# EasyEDA Pro project hardware_project.epro, schematic Schematic4, sheets 5 to 7 of 7

## Sheets
5 Lever-Shifter: Create Date: 2026-09-28; Page Name: P2; Update Date: 2026-09-28
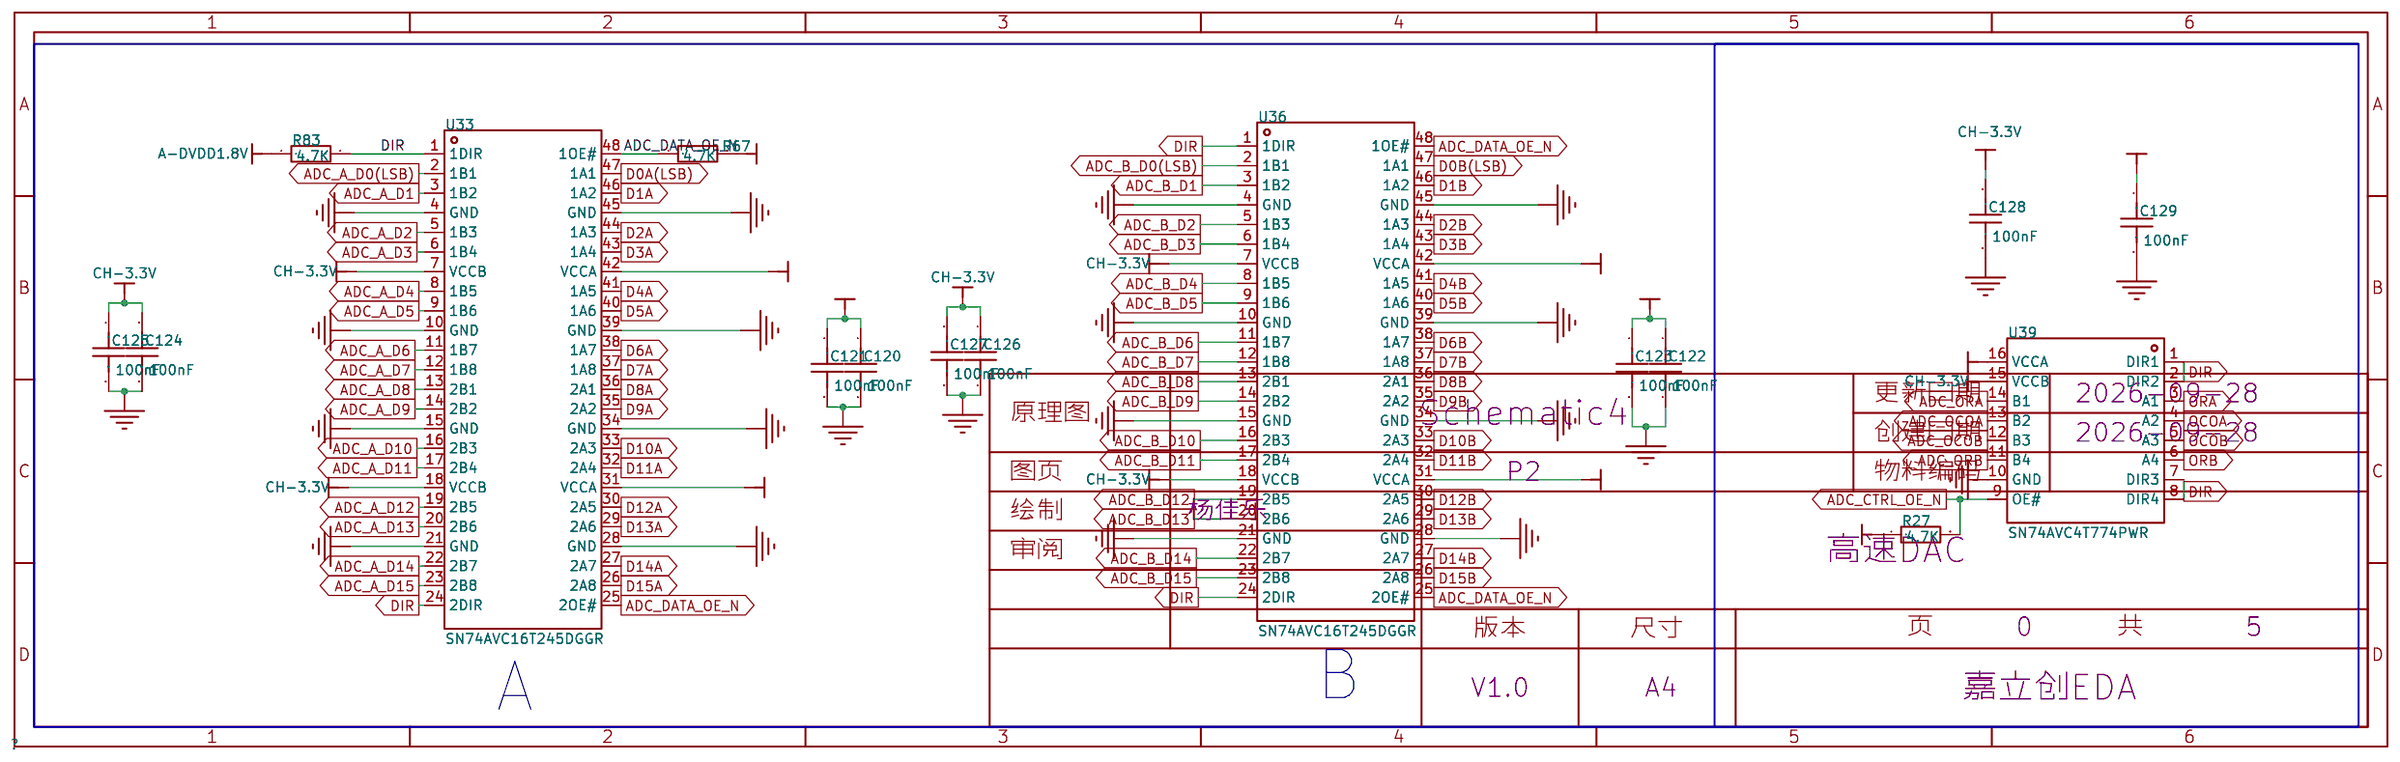
[diagram p4: Lever-Shifter]
6 AD9516-3: Create Date: 2026-09-28; Update Date: 2026-09-28
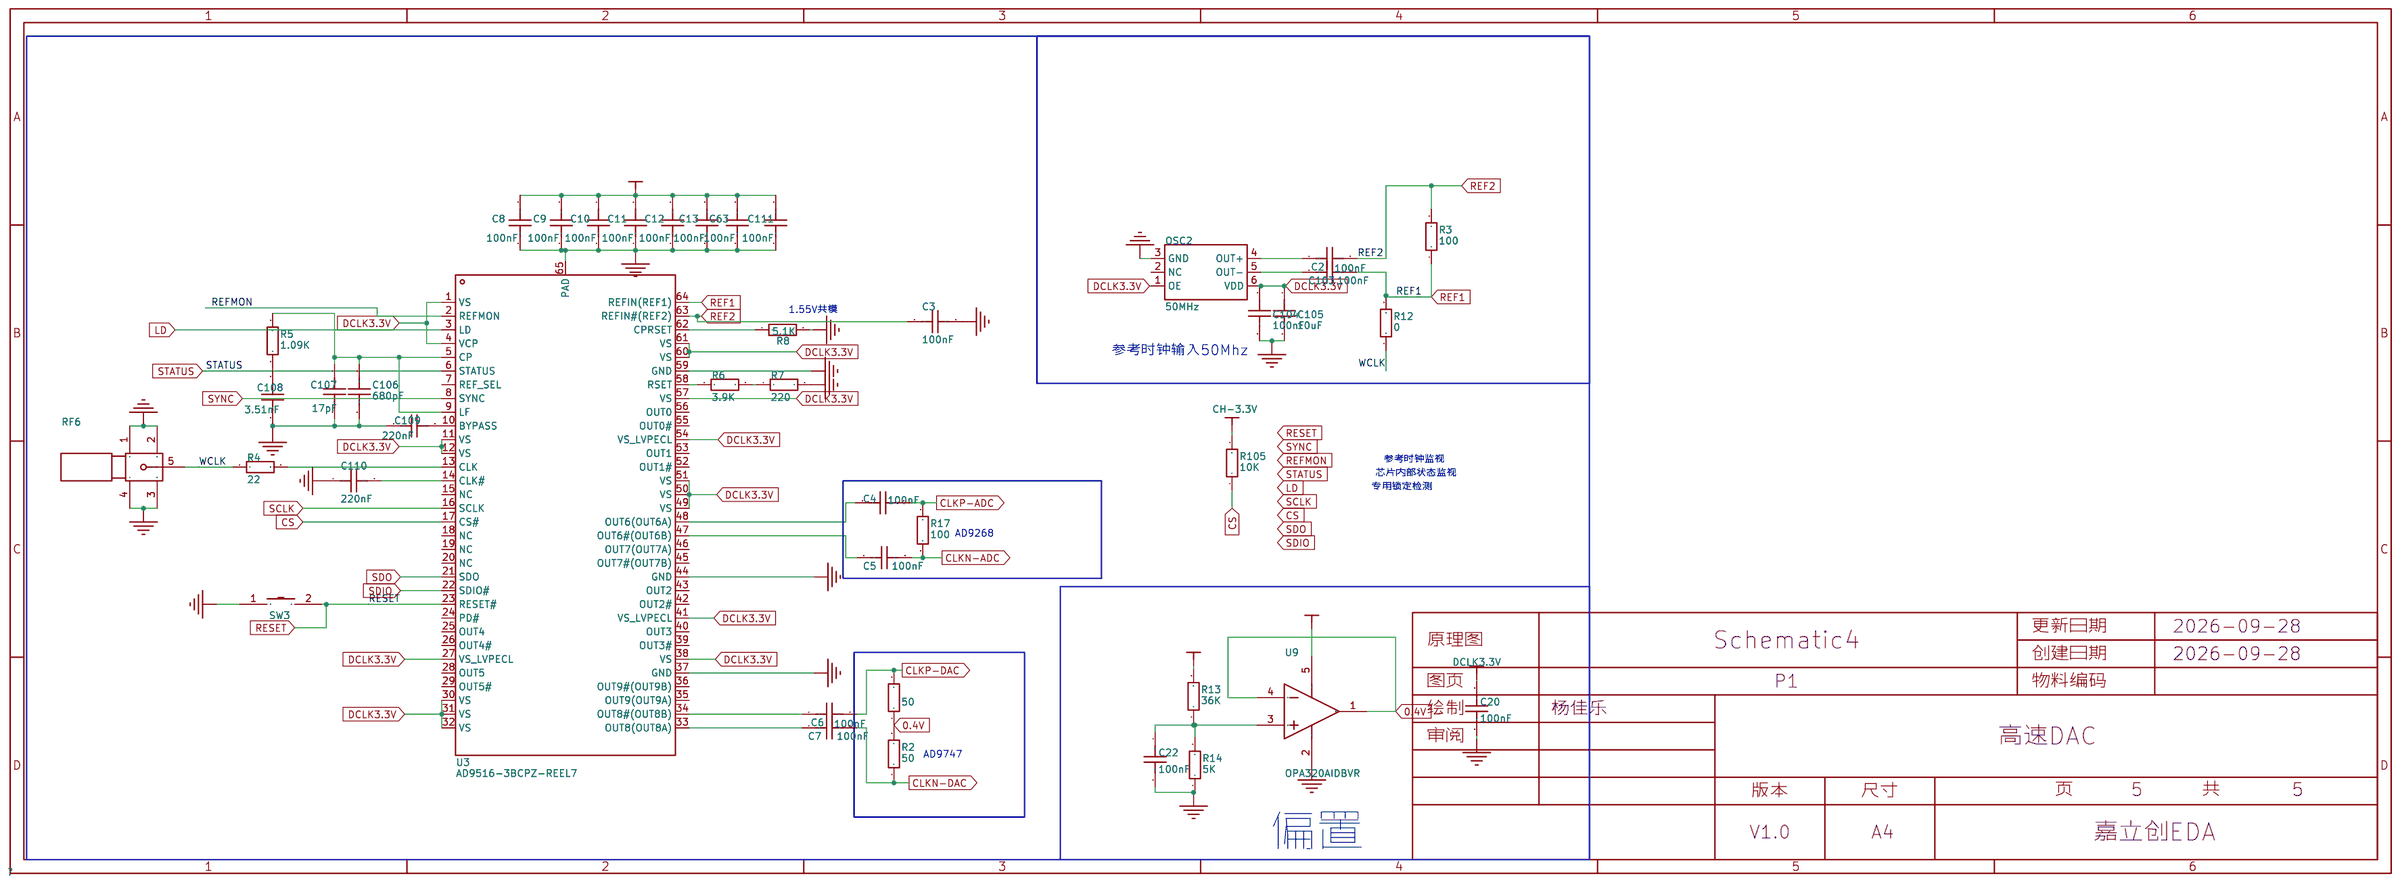
[diagram p5: AD9516-3]
7 AFE: Create Date: 2026-09-28; Update Date: 2026-09-28
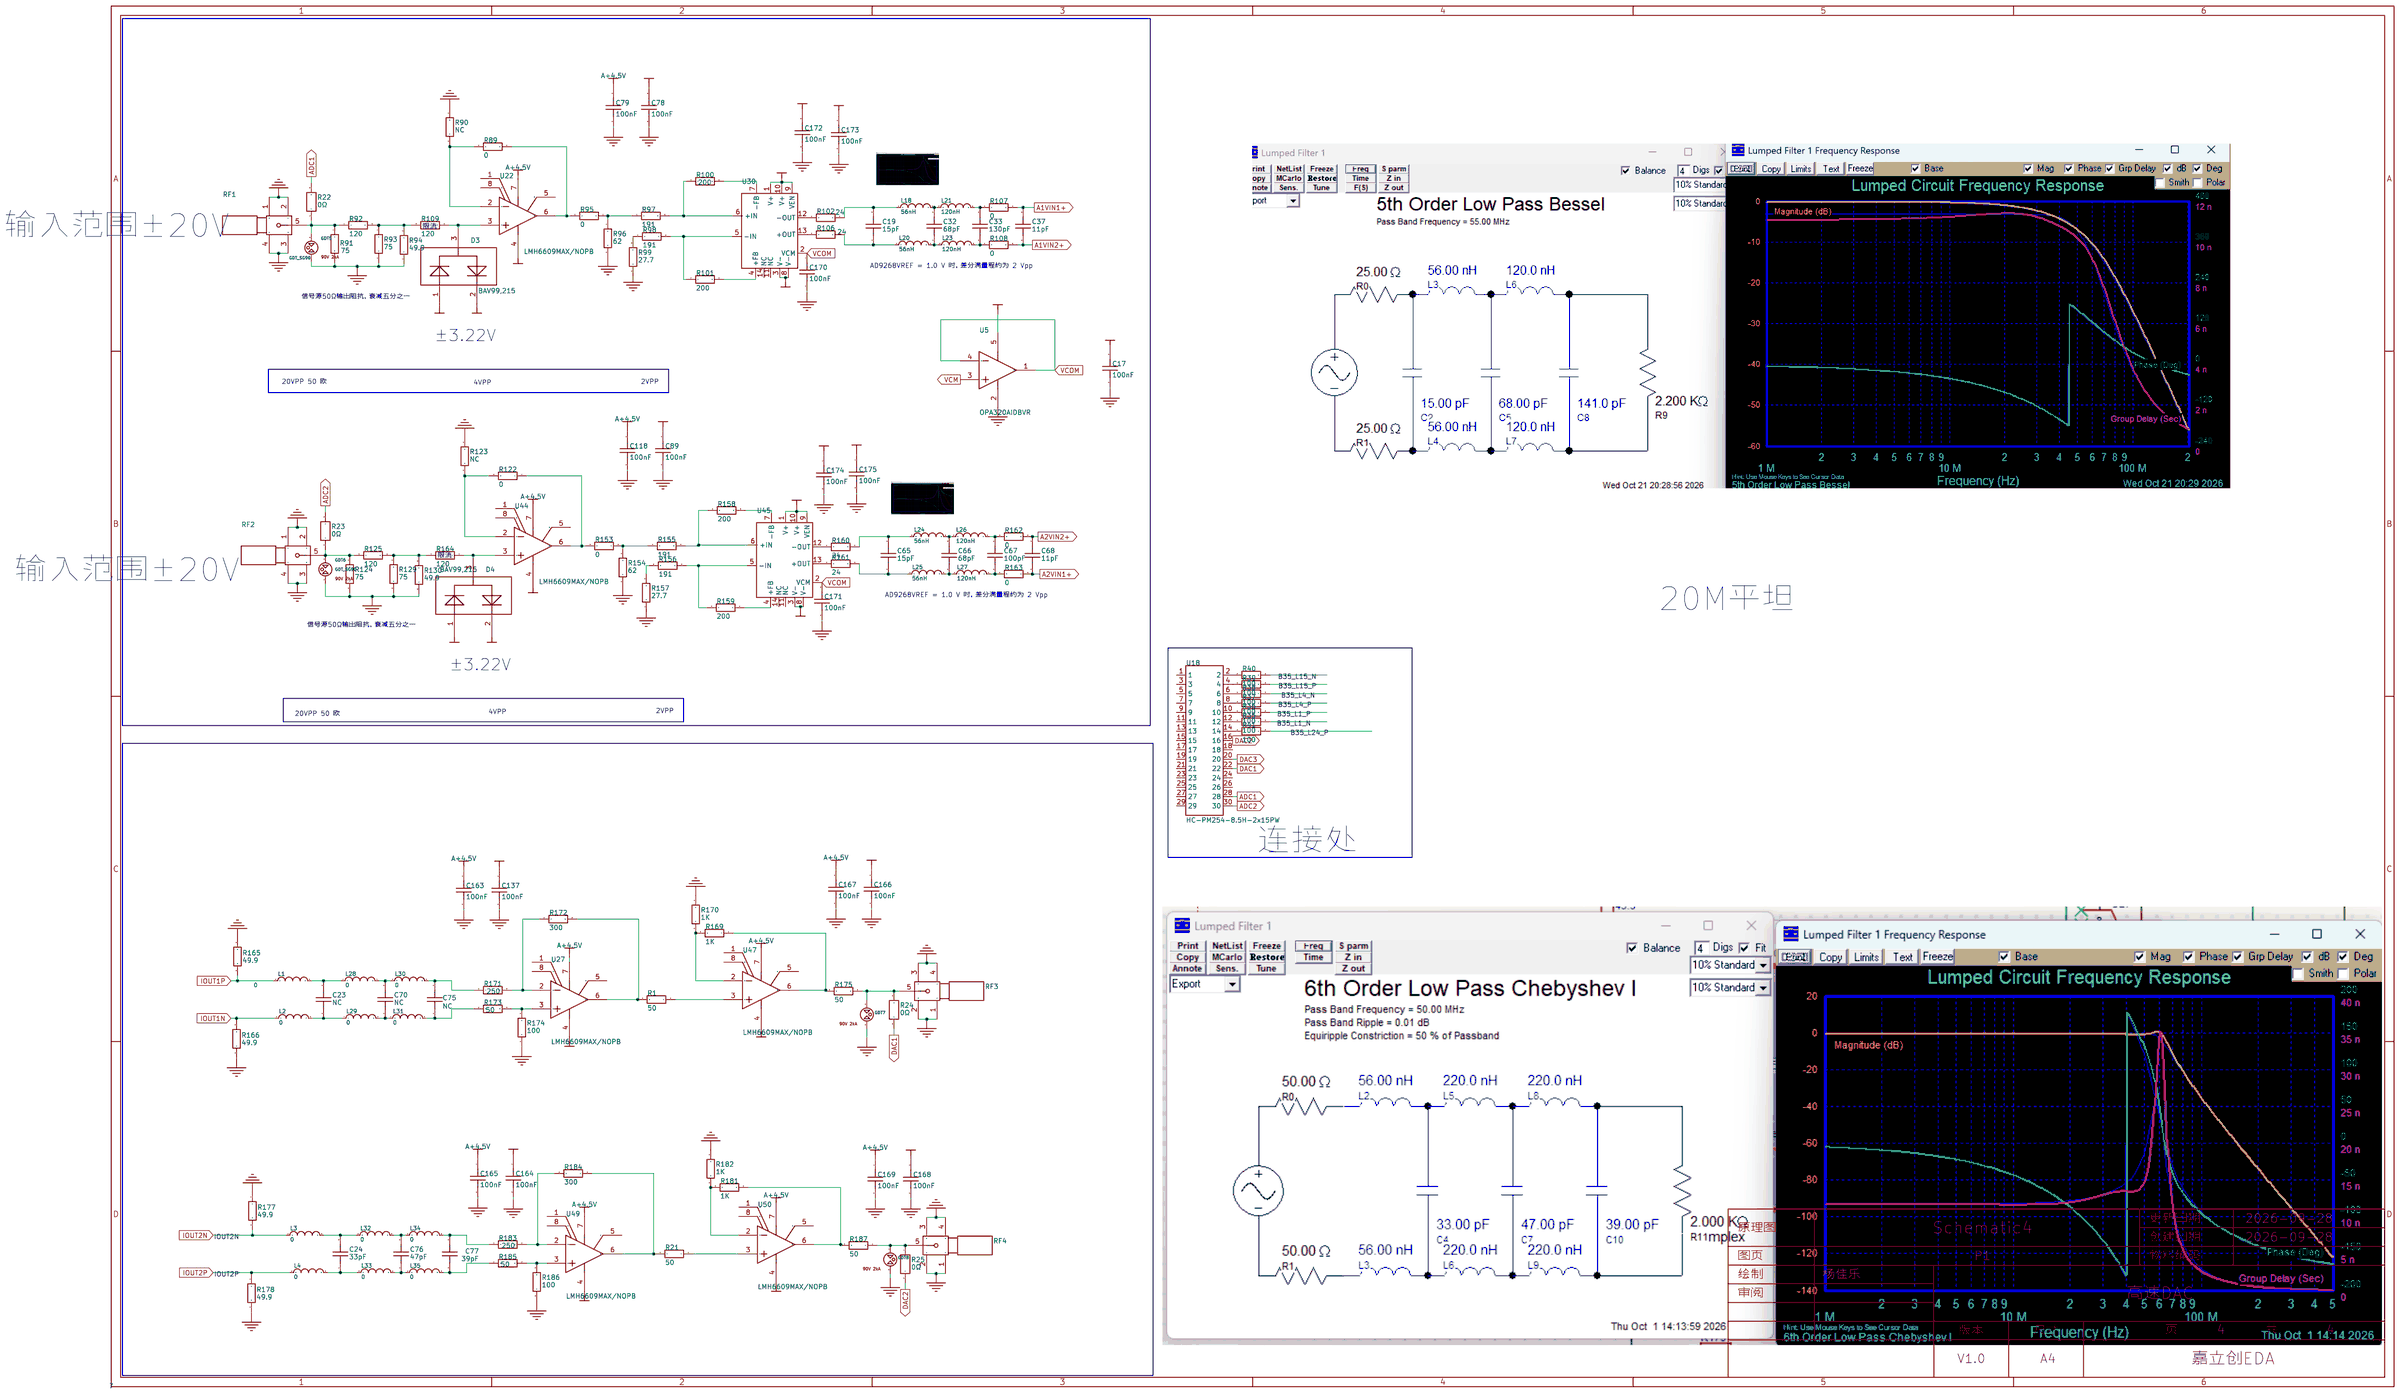
[diagram p6: AFE]

## Parts
sheet AD9516-3
C2  100nF  [C0603]
C3  100nF  [C0603]  (no BOM)
C4  100nF  [C0603]
C5  100nF  [C0603]
C6  100nF  [C0603]
C7  100nF  [C0603]
C8  100nF  [C0603]
C9  100nF  [C0603]
C10  100nF  [C0603]
C11  100nF  [C0603]
C12  100nF  [C0603]
C13  100nF  [C0603]
C20  100nF  [C0603]
C22  100nF  [C0603]
C63  100nF  [C0603]
C103  100nF  [C0603]
C104  100nF  [C0603]
C105  10uF  [C0603]
C106  680pF  [C0603]
C107  17pF  [C0603]
C108  3.51nF  [C0603]
C109  220nF  [C0603]
C110  220nF  [C0603]
C111  100nF  [C0603]
OSC2  50MHz  [OSC-SMD_6P-L3.2-W2.5-BL-1]
R2  50  [R0603]
R3  100  [R0603]
R4  22  [R0603]  (no BOM)
R5  1.09K  [R0603]
R6  3.9K  [R0603]
R7  220  [R0603]
R8  5.1K  [R0603]
R12  0  [R0603]  (no BOM)
R13  36K  [R0603]
R14  5K  [R0603]
R16  50  [R0603]
R17  100  [R0603]
R105  10K  [R0603]
RF6  -  [SMA-SMD_BWSMA-KE-P001]
SW3  -  [4脚平脚开关]
U3  AD9516-3BCPZ-REEL7  [LFCSP-64_L9.0-W9.0-P0.50-BL-EP6.2]
U9  OPA320AIDBVR  [SOT-23-5_L3.0-W1.7-P0.95-LS2.8-BR]
sheet AFE
C17  100nF  [C0603]
C19  15pF  [C0603]
C23  NC  [C0603]
C24  33pF  [C0603]
C32  68pF  [C0603]
C33  130pF  [C0603]
C37  11pF  [C0603]
C65  15pF  [C0603]
C66  68pF  [C0603]
C67  100pF  [C0603]
C68  11pF  [C0603]
C70  NC  [C0603]
C75  NC  [C0603]
C76  47pF  [C0603]
C77  39pF  [C0603]
C78  100nF  [C0603]
C79  100nF  [C0603]
C89  100nF  [C0603]
C118  100nF  [C0603]
C137  100nF  [C0603]
C163  100nF  [C0603]
C164  100nF  [C0603]
C165  100nF  [C0603]
C166  100nF  [C0603]
C167  100nF  [C0603]
C168  100nF  [C0603]
C169  100nF  [C0603]
C170  100nF  [C0603]
C171  100nF  [C0603]
C172  100nF  [C0603]
C173  100nF  [C0603]
C174  100nF  [C0603]
C175  100nF  [C0603]
D3  BAV99,215  [SOT-23-3_L2.9-W1.6-P1.90-LS2.8-BR]
D4  BAV99,215  [SOT-23-3_L2.9-W1.6-P1.90-LS2.8-BR]
GDT5  GDT_SG90  [ScopefunPackagesLibrary:GDT_SG]
GDT6  GDT_SG90  [ScopefunPackagesLibrary:GDT_SG]
GDT7  GDT_SG90  [ScopefunPackagesLibrary:GDT_SG]
GDT8  GDT_SG90  [ScopefunPackagesLibrary:GDT_SG]
L1  0  [IND-SMD_L1.8-W1.2]
L2  0  [IND-SMD_L1.8-W1.2]
L3  0  [IND-SMD_L1.8-W1.2]
L4  0  [IND-SMD_L1.8-W1.2]
L18  56nH  [IND-SMD_L1.8-W1.2]
L20  56nH  [IND-SMD_L1.8-W1.2]
L21  120nH  [IND-SMD_L1.8-W1.2]
L23  120nH  [IND-SMD_L1.8-W1.2]
L24  56nH  [IND-SMD_L1.8-W1.2]
L25  56nH  [IND-SMD_L1.8-W1.2]
L26  120nH  [IND-SMD_L1.8-W1.2]
L27  120nH  [IND-SMD_L1.8-W1.2]
L28  0  [IND-SMD_L1.8-W1.2]
L29  0  [IND-SMD_L1.8-W1.2]
L30  0  [IND-SMD_L1.8-W1.2]
L31  0  [IND-SMD_L1.8-W1.2]
L32  0  [IND-SMD_L1.8-W1.2]
L33  0  [IND-SMD_L1.8-W1.2]
L34  0  [IND-SMD_L1.8-W1.2]
L35  0  [IND-SMD_L1.8-W1.2]
R1  50  [R0603]
R21  50  [R0603]
R22  0Ω  [R0603]
R23  0Ω  [R0603]
R24  0Ω  [R0603]
R25  0Ω  [R0603]
R35  100  [R0603]
R36  100  [R0603]
R37  100  [R0603]
R38  100  [R0603]
R39  100  [R0603]
R40  100  [R0603]
R41  100  [R0603]
R89  0  [R0603]
R90  NC  [R0603]
R91  75  [R0603]
R92  120  [R0603]
R93  75  [R0603]
R94  49.9  [R0603]
R95  0  [R0603]
R96  62  [R0603]
R97  191  [R0603]
R98  191  [R0603]
R99  27.7  [R0603]
R100  200  [R0603]
R101  200  [R0603]
R102  24  [R0603]
R106  24  [R0603]
R107  0  [R0603]
R108  0  [R0603]
R109  120  [R0603]
R122  0  [R0603]
R123  NC  [R0603]
R124  75  [R0603]
R125  120  [R0603]
R129  75  [R0603]
R130  49.9  [R0603]
R153  0  [R0603]
R154  62  [R0603]
R155  191  [R0603]
R156  191  [R0603]
R157  27.7  [R0603]
R158  200  [R0603]
R159  200  [R0603]
R160  24  [R0603]
R161  24  [R0603]
R162  0  [R0603]
R163  0  [R0603]
R164  120  [R0603]
R165  49.9  [R0603]
R166  49.9  [R0603]
R169  1K  [R0603]
R170  1K  [R0603]
R171  250  [R0603]
R172  300  [R0603]
R173  50  [R0603]
R174  100  [R0603]
R175  50  [R0603]
R177  49.9  [R0603]
R178  49.9  [R0603]
R181  1K  [R0603]
R182  1K  [R0603]
R183  250  [R0603]
R184  300  [R0603]
R185  50  [R0603]
R186  100  [R0603]
R187  50  [R0603]
RF1  -  [SMA-SMD_BWSMA-KE-P001]
RF2  -  [SMA-SMD_BWSMA-KE-P001]
RF3  -  [SMA-SMD_BWSMA-KE-P001]
RF4  -  [SMA-SMD_BWSMA-KE-P001]
U5  OPA320AIDBVR  [SOT-23-5_L3.0-W1.7-P0.95-LS2.8-BR]
U18  HC-PM254-8.5H-2x15PW  [HDR-TH_30P-P2.54-H-F-R2-C15-W8.5]
U22  LMH6609MAX/NOPB  [SOP-8_L4.9-W3.9-P1.27-LS6.0-BL]
U27  LMH6609MAX/NOPB  [SOP-8_L4.9-W3.9-P1.27-LS6.0-BL]
U30  LMH6554LEE/NOPB  [UQFN-14_L2.5-W2.5-P0.40-BL]
U44  LMH6609MAX/NOPB  [SOP-8_L4.9-W3.9-P1.27-LS6.0-BL]
U45  LMH6554LEE/NOPB  [UQFN-14_L2.5-W2.5-P0.40-BL]
U47  LMH6609MAX/NOPB  [SOP-8_L4.9-W3.9-P1.27-LS6.0-BL]
U49  LMH6609MAX/NOPB  [SOP-8_L4.9-W3.9-P1.27-LS6.0-BL]
U50  LMH6609MAX/NOPB  [SOP-8_L4.9-W3.9-P1.27-LS6.0-BL]
sheet Lever-Shifter
C120  100nF  [C0603]
C121  100nF  [C0603]
C122  100nF  [C0603]
C123  100nF  [C0603]
C124  100nF  [C0603]
C125  100nF  [C0603]
C126  100nF  [C0603]
C127  100nF  [C0603]
C128  100nF  [C0603]
C129  100nF  [C0603]
R27  4.7K  [R0603]
R67  4.7K  [R0603]
R83  4.7K  [R0603]
U33  SN74AVC16T245DGGR  [TSSOP-48_L12.6-W6.2-P0.50-LS8.1-BL]
U36  SN74AVC16T245DGGR  [TSSOP-48_L12.6-W6.2-P0.50-LS8.1-BL]
U39  SN74AVC4T774PWR  [TSSOP-16_L5.0-W4.4-P0.65-LS6.4-BL]

## Library data of the parts
C2-C13 C17 C19 C20 C22-C24 C32 C33 C37 C63 C65-C68 C70 C75-C79 C89 C103-C111 C118 C120-C129 C137 C163-C175 = CAP_0603: Supplier Footprint: 0603
OSC2 = OB2EL89CLIB112YLC-50M: 频率:50MHz;常温频差:±20ppm;输出模式:LVDS;工作电压:2.5V~3.3V;频率稳定度:±30ppm;; LCSC Part Name: YSO230LR 50MHZ 2.5V-3.3V FS±50PPM -40~85℃ LVDS; Supplier Part: C41371108; Manufacturer: YXC(扬兴晶振); Supplier Footprint: SMD3225-6P; Datasheet: https://item.szlcsc.com/datasheet/OB2EL89CLIB112YLC-50M/43132132.html; Supplier: LCSC; Normal temperature Frequency Tolerance: ±20ppm; Output Type: LVDS; Voltage - Supply: 2.5V~3.3V; Frequency Stability: ±30ppm; Operating Temperature: -40℃~+85℃
R1-R8 R12-R14 R16 R17 R21 R27 R35-R41 R67 R83 R89-R102 R105-R109 R122-R125 R129 R130 R153-R166 R169-R175 R177 R178 R181-R187 = Res_0603: Supplier Footprint: 0603
RF1-RF4 RF6 = BWSMA-KE-P001: 连接器类型:板端;接口类型:内孔;端口数量:1;接口直径:5.2mm;接口长度/高度:-;频率:-;射频系列:SMA;阻抗:50Ω;样式:偏脚;工作温度:-;; LCSC Part Name: 内孔 SMA 偏脚; Supplier Part: C496550; Manufacturer: BAT WIRELESS(蝙蝠无线); Supplier Footprint: SMD; JLCPCB Part Class: Extended Part; Datasheet: https://item.szlcsc.com/datasheet/BWSMA-KE-P001/508499.html; Supplier: LCSC; Connector Type: 板端; Interface: 内孔; Number of Ports: 1; Interface Diameter: 5.2mm; RF Series: SMA; Impedance: 50Ω; Style: 偏脚
SW3 = 4脚平脚按键开关
U3 = AD9516-3BCPZ-REEL7: 接口类型:SPI;最大输出频率:2950MHz;输出通道数:14;; LCSC Part Name: 14-具有集成2.0 GHz VCO的输出时钟发生器; Supplier Part: C653501; Manufacturer: ADI(亚德诺); Supplier Footprint: LFCSP-64(9x9); JLCPCB Part Class: Extended Part; Datasheet: https://item.szlcsc.com/datasheet/AD9516-3BCPZ-REEL7/683055.html; Supplier: LCSC; Output Frequency (Max): 2.95GHz; Supply Voltage: 3.135V~3.465V; Operating Temperatue: -40℃~+85℃; Output Frequency(Max): 2950MHz; Voltage - Supply: 3.135V~3.465V; Number of Outputs: 14; Operating Temperature: -40℃~+85℃; Interface: SPI; Phase Offset: 支持; Clock/Oscillator: 内置；外置; Input: LVPECL；CMOS；LVDS; Output: CMOS；LVDS；LVPECL; Features: 片上VCO/DCO；内置锁相环；输出同步与相位对齐；内置时钟监测与失锁检测；自动参考切换；多源时钟输入
U5 U9 = OPA320AIDBVR: 放大器数:单路;输入失调电压(Vos):150uV;增益带宽积(GBW):20MHz;轨到轨:轨到轨输入,轨到轨输出;压摆率(SR):10V/us;输入偏置电流(Ib):0.2pA;; LCSC Part Name: 具备关断功能的精密、20 MHz、0.9 pA、低噪声、轨到轨输入输出CMOS运算放大器; Supplier Part: C92494; Manufacturer: TI(德州仪器); Supplier Footprint: SOT-23-5; JLCPCB Part Class: Extended Part; Datasheet: https://www.ti.com/cn/lit/ds/symlink/opa320.pdf; Supplier: LCSC; Number of Channels: 单路; Single Supply: 1.8V~5.5V; Dual Supply: 900mV~2.75V；-2.75V~-900mV; Vos - Input Offset Voltage: 150uV; Input Offset Voltage Drift(Vos TC): 1.5uV/℃; Gain Bandwidth Product: 20MHz; Rail to Rail: 轨到轨输入,轨到轨输出; Slew Rate: 10V/us; Common Mode Rejection Ratio(CMRR): 114dB; Input Voltage Noise Density: 7nV/√Hz@10kHz; Ib - Input Bias Current: 0.2pA; Quiescent Current(Iq): 1.45mA; Output Current: 65mA; Input Offset Current(Ios): 0.9pA; Operating Temperature: -40℃~+125℃; Features: EMI滤波/RF抑制；ESD保护；使能/关断功能；内置补偿；反相位输入保护
D3 D4 = BAV99,215: 二极管配置:1对串联式;整流电流:215mA;直流反向耐压(Vr):100V;正向压降(Vf):1.25V@150mA;反向恢复时间(Trr):4ns;; LCSC Part Name: 100V 215mA; Supplier Part: C2500; Manufacturer: Nexperia(安世); Supplier Footprint: SOT-23; JLCPCB Part Class: Basic Part; Datasheet: https://item.szlcsc.com/datasheet/BAV99%252C215/2877.html; Supplier: LCSC; Diode Configuration: 1对串联式; Pd - Power Dissipation: 250mW; Current - Rectified: 215mA; Voltage - DC Reverse(Vr): 100V; Voltage - Forward(Vf@If): 1.25V@150mA; Non-Repetitive Peak Forward Surge Current: 4A; Reverse Leakage Current (Ir): 500nA@80V; Reverse Recovery Time (trr): 4ns
GDT5-GDT8 = ScopefunParts_GDT_SG90: Gas Discharge Tube - GDT 90V 2kA <1.0 pF; UserDocLink: https://www.littelfuse.com/~/media/electronics/datasheets/gas_discharge_tubes/littelfuse_gdt_sg_datasheet.pdf.pdf; MFG Part#: SG90
L1-L4 L18 L20 L21 L23-L35 = HWC1608J33ND: 电感值:33nH;精度:±5%;额定电流:600mA;直流电阻(DCR):220mΩ;; LCSC Part Name: 高频电感; Supplier Part: C54534282; Manufacturer: Coilank(驰兴电感); Supplier Footprint: 0603; JLCPCB Part Class: Extended Part; Datasheet: https://item.szlcsc.com/datasheet/HWC1608J33ND/57888317.html; Supplier: LCSC; Tolerance: ±5%; Current Rating: 600mA; DC Resistance(DCR): 220mΩ; Q @ Frequency: 40@250MHz; Frequency - Self Resonant: 2.3GHz; Type: 绕线电感
R22-R25 = FRC0603F0000TS: 电阻类型:厚膜电阻;阻值:0Ω;精度:±1%;功率:100mW;工作电压:75V;; LCSC Part Name: 0Ω ±1% 100mW 厚膜电阻; Supplier Part: C2906974; Manufacturer: FOJAN(富捷); Supplier Footprint: 0603; JLCPCB Part Class: Extended Part; Supplier: LCSC; Type: 厚膜电阻; Tolerance: ±1%; Power(Watts): 100mW; Voltage-Supply(Max): 75V; Operating Temperature: -55℃~+155℃
U18 = HC-PM254-8.5H-2x15PW: 插孔结构:2x15P;间距:2.54mm;行距:2.54mm;圆孔/方孔:方孔;安装方式:弯插;排数:双排;总孔位数:30P;额定电流:3A;额定电压:-;插孔方向:侧面;塑高:5mm;触头材质:黄铜;触头镀层:金;工作温度:-40℃~+105℃;; LCSC Part Name: 间距2.54mm 2x15Pin 弯插 PC3.2 PB12.7 H8.5; Supplier Part: C22373938; Manufacturer: HC(虹成电子); Supplier Footprint: 弯插,P=2.54mm; JLCPCB Part Class: Extended Part; Datasheet: https://item.szlcsc.com/datasheet/HC-PM254-8.5H-2x15PW/23870275.html; Supplier: LCSC; Holes Structure: 2x15P; Pitch: 2.54mm; Row Spacing: 2.54mm; Circular Hole / Square Hole: 方孔; Mounting Type: 弯插; Number of Rows: 双排; Number of Positions: 30P; Current Rating: 3A; Holes Direction: 侧面; Insulation Height: 5mm; Contact Material: 黄铜; Contact Plating: 金; Operating Temperature: -40℃~+105℃; PIN Length: 3mm
U22 U27 U44 U47 U49 U50 = LMH6609MAX/NOPB: 放大器数:1;轨到轨:-;增益带宽积(GBW):240MHz;输入失调电压(Vos):800uV;压摆率(SR):1.4V/ns;输入偏置电流(Ib):2uA;; LCSC Part Name: 900MHz电压反馈运算放大器; Supplier Part: C2060005; Manufacturer: TI(德州仪器); Supplier Footprint: SOIC-8; JLCPCB Part Class: Extended Part; Datasheet: https://www.ti.com/cn/lit/ds/symlink/lmh6609.pdf; Supplier: LCSC; Number of Channels: 1; Gain Bandwidth Product: 240MHz; Vos - Input Offset Voltage: 800uV; Input Offset Voltage Drift(Vos TC): 4uV/℃; Slew Rate: 1.4V/ns; Ib - Input Bias Current: 2uA; Input Offset Current(Ios): 1.5uA; Input Voltage Noise Density: 3.1nV/√Hz@1MHz; Common Mode Rejection Ratio(CMRR): 73dB; Quiescent Current: 7mA; Output Current: 90mA; Operating Temperature: -40℃~+85℃; Single supply: 6.6V~12V; Dual Supply: -6V~6V; Features: 内置补偿；ESD保护
U30 U45 = LMH6554LEE/NOPB: 放大器数:单路;共模抑制比(CMRR):83dB;输入偏置电流(Ib):20uA;输入失调电压(Vos):16mV;增益带宽积(GBP):2.8GHz;压摆率(SR):6200V/us;轨到轨:-;; LCSC Part Name: LMH6554 2.8-GHz 超线性全差分放大器; Supplier Part: C701927; Manufacturer: TI(德州仪器); Supplier Footprint: UQFN-14(2.5x2.5); JLCPCB Part Class: Extended Part; Datasheet: https://www.ti.com/cn/lit/ds/symlink/lmh6554.pdf; Supplier: LCSC; Number of Channels: 单路; Common Mode Rejection Ratio(CMRR): 83dB; Ib - Input Bias Current: 20uA; Vos - Input Offset Voltage: 16mV; Gain Bandwidth Product: 2.8GHz; Slew Rate: 6200V/us; Maximum Power Supply Range (Vdd-Vss): 5.25V; Noise density(eN): 0.9nV/√Hz@10MHz; Output Current: 150mA; Input Offset Current(Ios): 18uA; Quiescent Current per Amplifier: 52mA; Operating Temperature: -40℃~+125℃; Output Type: 差分; Single Supply: 4.7V~5.25V; Dual Supply: -2.5V~2.5V; Power Supply Rejection Ratio (PSRR): 95dB; Settling time: 4ns; Features: 输出共模电压可调；内置补偿；使能/关断功能；容性负载驱动；单端转差分转换；集成ADC驱动器
U33 U36 = SN74AVC16T245DGGR: SN74AVC16T245 具有可配置电压转换和三态输出的 16 位双电源总线收发器; LCSC Part Name: 具备可配置电平转换/电压转换功能和三态输出的16位双电源总线收发器; Supplier Part: C148481; Manufacturer: TI(德州仪器); Supplier Footprint: TSSOP-48-6.2mm; JLCPCB Part Class: Extended Part; Datasheet: https://www.ti.com/cn/lit/ds/symlink/sn74avc16t245.pdf; Supplier: LCSC; Features: 断电保护；输出使能高阻; Translator Type: 电平转换器
U39 = SN74AVC4T774PWR: 数据速率:380Mbps;工作电压(VCCA):1.2V~3.6V;工作电压(VCCB):1.2V~3.6V;元件数:1;每个电路通道数:4;; LCSC Part Name: 4位双电源总线收发器，带可配置电压转换和三态输出; Supplier Part: C129363; Manufacturer: TI(德州仪器); Supplier Footprint: TSSOP-16; JLCPCB Part Class: Extended Part; Datasheet: https://www.ti.com/cn/lit/ds/symlink/sn74avc4t774.pdf; Supplier: LCSC; Channel Type: 双向; Data Rate: 380Mbps; Voltage - Supply(VCCA): 1.2V~3.6V; Voltage - Supply(VCCB): 1.2V~3.6V; Number of Elements: 1; Number of Circuits: 4; Output Type: 三态; Operating Temperature: -40℃~+85℃; Features: 断电保护；输出使能高阻; Translator Type: 电平转换器

## Nets
0.4V: R2.2 R16.1 U9.1(OUT) U9.4(IN-)
A1VIN1+: C37.2 R107.2 ; also on sheet 1
A1VIN2+: C37.1 R108.2 ; also on sheet 1
A2VIN1+: C68.1 R163.2 ; also on sheet 1
A2VIN2+: C68.2 R162.2 ; also on sheet 1
GND: C3.1 C8.1 C9.1 C10.1 C11.1 C12.1 C13.1 C17.2 C20.2 C22.2 C63.1 C78.2 C79.2 C89.2 C104.2 C105.2 C106.1 C107.1 C108.1 C109.1 C110.1 C111.1 C118.2 C120.2 C121.2 C122.2 C123.2 C124.2 C125.2 C126.2 C127.2 C128.2 C129.2 C137.2 C163.2 C164.2 C165.2 C166.2 C167.2 C168.2 C169.2 C170.2 C171.2 C172.2 C173.2 C174.2 C175.2 GDT5.2 GDT6.2 GDT7.2 GDT8.2 OSC2.3(GND) R7.2 R8.2 R14.1 R90.1 R91.2 R93.2 R94.1 R96.2 R99.1 R123.1 R124.2 R129.2 R130.1 R154.2 R157.1 R165.1 R166.2 R170.1 R174.1 R177.1 R178.2 R182.1 R186.1 RF1.1 RF1.2 RF1.3 RF1.4 RF2.1 RF2.2 RF2.3 RF2.4 RF3.1 RF3.2 RF3.3 RF3.4 RF4.1 RF4.2 RF4.3 RF4.4 RF6.1 RF6.2 RF6.3 RF6.4 SW3.1 U3.37(GND) U3.44(GND) U3.59(GND) U3.65(PAD) U5.2(V-) U9.2(V-) U33.4(GND) U33.10(GND) U33.15(GND) U33.21(GND) U33.28(GND) U33.34(GND) U33.39(GND) U33.45(GND) U36.4(GND) U36.10(GND) U36.15(GND) U36.21(GND) U36.28(GND) U36.34(GND) U36.39(GND) U36.45(GND) U39.10(GND) ; also on sheet 1 3 4
A+2.5V: C172.1 C174.1 D3.2 D4.2 U30.1(V+) U30.9(VEN) U30.10(V+) U45.1(V+) U45.9(VEN) U45.10(V+) ; also on sheet 3
A+4.5V: C17.1 C79.1 C118.1 C163.1 C165.1 C167.1 C169.1 U5.5(V+) U22.7(V+) U27.7(V+) U44.7(V+) U47.7(V+) U49.7(V+) U50.7(V+) ; also on sheet 1 3
A-2.5V: C173.1 C175.1 D3.1 D4.1 U30.3(V-) U30.8(V-) U45.3(V-) U45.8(V-) ; also on sheet 3
A-4.5V: C78.1 C89.1 C137.1 C164.1 C166.1 C168.1 U22.4(V-) U27.4(V-) U44.4(V-) U47.4(V-) U49.4(V-) U50.4(V-) ; also on sheet 3
A-DVDD1.8V: C120.1 C121.1 C122.1 C123.1 C129.1 R27.1 R67.2 R83.1 U33.31(VCCA) U33.42(VCCA) U36.31(VCCA) U36.42(VCCA) U39.16(VCCA) ; also on sheet 1 3
ADC1: R22.2 U18.28
ADC2: R23.2 U18.30
ADC_A_D0(LSB): U33.2(1B1) ; also on sheet 4
ADC_A_D1: U33.3(1B2) ; also on sheet 4
ADC_A_D2: U33.5(1B3) ; also on sheet 4
ADC_A_D3: U33.6(1B4) ; also on sheet 4
ADC_A_D4: U33.8(1B5) ; also on sheet 4
ADC_A_D5: U33.9(1B6) ; also on sheet 4
ADC_A_D6: U33.11(1B7) ; also on sheet 4
ADC_A_D7: U33.12(1B8) ; also on sheet 4
ADC_A_D8: U33.13(2B1) ; also on sheet 4
ADC_A_D9: U33.14(2B2) ; also on sheet 4
ADC_A_D10: U33.16(2B3) ; also on sheet 4
ADC_A_D11: U33.17(2B4) ; also on sheet 4
ADC_A_D12: U33.19(2B5) ; also on sheet 4
ADC_A_D13: U33.20(2B6) ; also on sheet 4
ADC_A_D14: U33.22(2B7) ; also on sheet 4
ADC_A_D15: U33.23(2B8) ; also on sheet 4
ADC_B_D0(LSB): U36.2(1B1) ; also on sheet 4
ADC_B_D1: U36.3(1B2) ; also on sheet 4
ADC_B_D2: U36.5(1B3) ; also on sheet 4
ADC_B_D3: U36.6(1B4) ; also on sheet 4
ADC_B_D4: U36.8(1B5) ; also on sheet 4
ADC_B_D5: U36.9(1B6) ; also on sheet 4
ADC_B_D6: U36.11(1B7) ; also on sheet 4
ADC_B_D7: U36.12(1B8) ; also on sheet 4
ADC_B_D8: U36.13(2B1) ; also on sheet 4
ADC_B_D9: U36.14(2B2) ; also on sheet 4
ADC_B_D10: U36.16(2B3) ; also on sheet 4
ADC_B_D11: U36.17(2B4) ; also on sheet 4
ADC_B_D12: U36.19(2B5) ; also on sheet 4
ADC_B_D13: U36.20(2B6) ; also on sheet 4
ADC_B_D14: U36.22(2B7) ; also on sheet 4
ADC_B_D15: U36.23(2B8) ; also on sheet 4
ADC_CTRL_OE_N: R27.2 U39.9(OE#) ; also on sheet 4
ADC_DATA_OE_N: R67.1 U33.25(2OE#) U33.48(1OE#) U36.25(2OE#) U36.48(1OE#) ; also on sheet 4
ADC_OCOA: U39.13(B2) ; also on sheet 4
ADC_OCOB: U39.12(B3) ; also on sheet 4
ADC_ORA: U39.14(B1) ; also on sheet 4
ADC_ORB: U39.11(B4) ; also on sheet 4
B35_L1_N: R35.2 ; also on sheet 4
B35_L1_P: R36.2 ; also on sheet 4
B35_L4_N: R38.2 ; also on sheet 4
B35_L4_P: R37.2 ; also on sheet 4
B35_L8_N: U3.8(SYNC) ; also on sheet 4
B35_L8_P: SW3.2 U3.23(RESET#) ; also on sheet 4
B35_L9_N: U3.2(REFMON) ; also on sheet 4
B35_L9_P: U3.6(STATUS) ; also on sheet 4
B35_L15_N: R40.2 ; also on sheet 4
B35_L15_P: R39.2 ; also on sheet 4
B35_L24_P: R41.2 ; also on sheet 4
CH-3.3V: C124.1 C125.1 C126.1 C127.1 C128.1 R105.2 U33.7(VCCB) U33.18(VCCB) U36.7(VCCB) U36.18(VCCB) U39.15(VCCB) ; also on sheet 1 3 4
CLKN: C7.2 R2.1 ; also on sheet 1
CLKN-ADC: C5.2 R17.1 ; also on sheet 1
CLKP: C6.2 R16.2 ; also on sheet 1
CLKP-ADC: C4.2 R17.2 ; also on sheet 1
CS: R105.1 U3.17(CS#) ; also on sheet 4
D0A(LSB): U33.47(1A1) ; also on sheet 1
D0B(LSB): U36.47(1A1) ; also on sheet 1
D1A: U33.46(1A2) ; also on sheet 1
D1B: U36.46(1A2) ; also on sheet 1
D2A: U33.44(1A3) ; also on sheet 1
D2B: U36.44(1A3) ; also on sheet 1
D3A: U33.43(1A4) ; also on sheet 1
D3B: U36.43(1A4) ; also on sheet 1
D4A: U33.41(1A5) ; also on sheet 1
D4B: U36.41(1A5) ; also on sheet 1
D5A: U33.40(1A6) ; also on sheet 1
D5B: U36.40(1A6) ; also on sheet 1
D6A: U33.38(1A7) ; also on sheet 1
D6B: U36.38(1A7) ; also on sheet 1
D7A: U33.37(1A8) ; also on sheet 1
D7B: U36.37(1A8) ; also on sheet 1
D8A: U33.36(2A1) ; also on sheet 1
D8B: U36.36(2A1) ; also on sheet 1
D9A: U33.35(2A2) ; also on sheet 1
D9B: U36.35(2A2) ; also on sheet 1
D10A: U33.33(2A3) ; also on sheet 1
D10B: U36.33(2A3) ; also on sheet 1
D11A: U33.32(2A4) ; also on sheet 1
D11B: U36.32(2A4) ; also on sheet 1
D12A: U33.30(2A5) ; also on sheet 1
D12B: U36.30(2A5) ; also on sheet 1
D13A: U33.29(2A6) ; also on sheet 1
D13B: U36.29(2A6) ; also on sheet 1
D14A: U33.27(2A7) ; also on sheet 1
D14B: U36.27(2A7) ; also on sheet 1
D15A: U33.26(2A8) ; also on sheet 1
D15B: U36.26(2A8) ; also on sheet 1
DAC1: R24.2 U18.22
DAC2: R25.2 U18.16
DAC3: U18.20 ; also on sheet 1
DCLK3.3V: C8.2 C9.2 C10.2 C11.2 C12.2 C13.2 C20.1 C63.2 C104.1 C105.1 C111.2 OSC2.1(OE) OSC2.6(VDD) R13.2 U3.1(VS) U3.4(VCP) U3.11(VS) U3.12(VS) U3.27(VS_LVPECL) U3.30(VS) U3.31(VS) U3.32(VS) U3.38(VS) U3.41(VS_LVPECL) U3.49(VS) U3.50(VS) U3.51(VS) U3.54(VS_LVPECL) U3.57(VS) U3.60(VS) U3.61(VS) U9.5(V+) ; also on sheet 3
DCOA: U39.4(A2) ; also on sheet 1
DCOB: U39.5(A3) ; also on sheet 1
DIR: R83.2 U33.1(1DIR) U33.24(2DIR) U36.1(1DIR) U36.24(2DIR) U39.1(DIR1) U39.2(DIR2) U39.7(DIR3) U39.8(DIR4)
IOUT1N: L2.1 R166.1 ; also on sheet 1
IOUT1P: L1.1 R165.2 ; also on sheet 1
IOUT2N: L3.1 R177.2 ; also on sheet 1
IOUT2P: L4.1 R178.1 ; also on sheet 1
LD: U3.3(LD) ; also on sheet 4
ORA: U39.3(A1) ; also on sheet 1
ORB: U39.6(A4) ; also on sheet 1
PS_MIO7: U3.16(SCLK) ; also on sheet 1 4
PS_MIO8: U3.22(SDIO#) ; also on sheet 1 4
PS_MIO9: U3.21(SDO) ; also on sheet 1 4
REF1: C103.2 R3.1 R12.2 U3.64(REFIN(REF1))
REF2: C2.2 C3.2 R3.2 U3.63(REFIN#(REF2))
VCM: U5.3(IN+) ; also on sheet 1
VCOM: C170.1 C171.1 U5.1(OUT) U5.4(IN-) U30.2(VCM) U45.2(VCM)
WCLK: R4.1 R12.1 RF6.5
$C2_1: C2.1 OSC2.4(OUT+)
$C4_1: C4.1 U3.48(OUT6(OUT6A))
$C5_1: C5.1 U3.47(OUT6#(OUT6B))
$C6_1: C6.1 U3.34(OUT8#(OUT8B))
$C7_1: C7.1 U3.33(OUT8(OUT8A))
$C19_1: C19.1 L20.1 R106.2
$C19_2: C19.2 L18.1 R102.2
$C22_1: C22.1 R13.1 R14.2 U9.3(IN+)
$C23_1: C23.1 L2.2 L29.1
$C23_2: C23.2 L1.2 L28.1
$C24_1: C24.1 L4.2 L33.1
$C24_2: C24.2 L3.2 L32.1
$C32_1: C32.1 L20.2 L23.1
$C32_2: C32.2 L18.2 L21.1
$C33_1: C33.1 L23.2 R108.1
$C33_2: C33.2 L21.2 R107.1
$C65_1: C65.1 L25.1 R161.2
$C65_2: C65.2 L24.1 R160.2
$C66_1: C66.1 L25.2 L27.1
$C66_2: C66.2 L24.2 L26.1
$C67_1: C67.1 L27.2 R163.1
$C67_2: C67.2 L26.2 R162.1
$C70_1: C70.1 L29.2 L31.1
$C70_2: C70.2 L28.2 L30.1
$C75_1: C75.1 L31.2 R173.1
$C75_2: C75.2 L30.2 R171.1
$C76_1: C76.1 L33.2 L35.1
$C76_2: C76.2 L32.2 L34.1
$C77_1: C77.1 L35.2 R185.1
$C77_2: C77.2 L34.2 R183.1
$C103_1: C103.1 OSC2.5(OUT-)
$C106_2: C106.2 C107.2 R5.1 U3.5(CP) U3.9(LF)
$C108_2: C108.2 R5.2
$C109_2: C109.2 U3.10(BYPASS)
$C110_2: C110.2 U3.14(CLK#)
$D3_3: D3.3 R109.1 U22.3(IN+)
$D4_3: D4.3 R164.1 U44.3(IN+)
$GDT5_1: GDT5.1 R22.1 R91.1 R92.1 RF1.5
$GDT6_1: GDT6.1 R23.1 R124.1 R125.1 RF2.5
$GDT7_1: GDT7.1 R24.1 R175.1 RF3.5
$GDT8_1: GDT8.1 R25.1 R187.1 RF4.5
$R1_1: R1.1 U47.3(IN+)
$R1_2: R1.2 R172.2 U27.6(OUT)
$R4_2: R4.2 U3.13(CLK)
$R6_1: R6.1 U3.58(RSET)
$R6_2: R6.2 R7.1
$R8_1: R8.1 U3.62(CPRSET)
$R21_1: R21.1 U50.3(IN+)
$R35_1: R35.1 U18.12
$R36_1: R36.1 U18.10
$R37_1: R37.1 U18.8
$R38_1: R38.1 U18.6
$R39_1: R39.1 U18.4
$R40_1: R40.1 U18.2
$R41_1: R41.1 U18.14
$R89_1: R89.1 R95.2 U22.6(OUT)
$R89_2: R89.2 R90.2 U22.2(IN-)
$R95_1: R95.1 R96.1 R97.1
$R98_1: R98.1 R99.2
$R100_1: R97.2 R100.1 U30.6(+IN)
$R100_2: R100.2 U30.7(-FB)
$R101_1: R101.1 U30.4(+FB)
$R101_2: R98.2 R101.2 U30.5(-IN)
$R102_1: R102.1 U30.12(-OUT)
$R106_1: R106.1 U30.13(+OUT)
$R109_2: R92.2 R93.1 R94.2 R109.2
$R122_1: R122.1 R153.2 U44.6(OUT)
$R122_2: R122.2 R123.2 U44.2(IN-)
$R125_2: R125.2 R129.1 R130.2 R164.2
$R153_1: R153.1 R154.1 R155.1
$R155_2: R155.2 R158.1 U45.6(+IN)
$R156_1: R156.1 R157.2
$R156_2: R156.2 R159.2 U45.5(-IN)
$R158_2: R158.2 U45.7(-FB)
$R159_1: R159.1 U45.4(+FB)
$R160_1: R160.1 U45.12(-OUT)
$R161_1: R161.1 U45.13(+OUT)
$R169_1: R169.1 R175.2 U47.6(OUT)
$R169_2: R169.2 R170.2 U47.2(IN-)
$R171_2: R171.2 R172.1 U27.2(IN-)
$R173_2: R173.2 R174.2 U27.3(IN+)
$R181_1: R181.1 R187.2 U50.6(OUT)
$R181_2: R181.2 R182.2 U50.2(IN-)
$R183_2: R183.2 R184.1 U49.2(IN-)
$R184_2: R21.2 R184.2 U49.6(OUT)
$R185_2: R185.2 R186.2 U49.3(IN+)

Not connected (* = marked no-connect by the designer): OSC2 2(NC); U3 7(REF_SEL) 15(NC) 18(NC) 19(NC) 20(NC) 24(PD#) 25(OUT4) 26(OUT4#) 28(OUT5) 29(OUT5#) 35(OUT9(OUT9A)) 36(OUT9#(OUT9B)) 39(OUT3#) 40(OUT3) 42(OUT2#) 43(OUT2) 45(OUT7#(OUT7B)) 46(OUT7(OUT7A)) 52(OUT1#) 53(OUT1) 55(OUT0#) 56(OUT0); U18 1 3 5 7 9 11 13 15 17 18 19 21 23 24 25 26 27 29; U22 1(NC) 5(NC) 8(NC); U27 1(NC) 5(NC) 8(NC); U30 11(NC) 14(NC); U44 1(NC) 5(NC) 8(NC); U45 11(NC) 14(NC); U47 1(NC) 5(NC) 8(NC); U49 1(NC) 5(NC) 8(NC); U50 1(NC) 5(NC) 8(NC)

## Notes on the sheets
sheet 5
- A
- B
sheet 6
- 1.55V共模
- 参考时钟输入50Mhz
- 参考时钟监视
- 芯片内部状态监视
- 专用锁定检测
- AD9268
- AD9747
- 偏置
sheet 7
- 限流
- 输入范围±20V
- AD9268VREF = 1.0 V 时，差分满量程约为 2 Vpp
- 信号源50Ω输出阻抗，衰减五分之一
- ±3.22V
- 20VPP 50 欧
- 4VPP
- 2VPP
- 限流
- 输入范围±20V
- AD9268VREF = 1.0 V 时，差分满量程约为 2 Vpp
- 20M平坦
- 信号源50Ω输出阻抗，衰减五分之一
- ±3.22V
- 20VPP 50 欧
- 4VPP
- 2VPP
- 连接处
